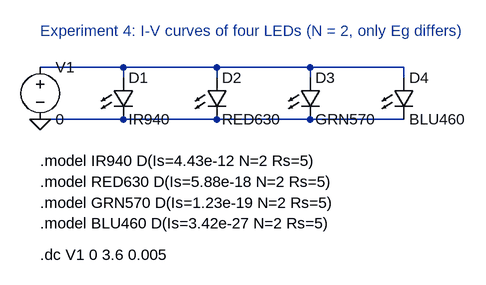
[diagram p0: schematic LED_IV_Kennlinien.asc]
LED_IV_Kennlinien.asc, the LTspice schematic file:
Version 4.1
SHEET 1 880 440
WIRE 80 80 208 80
WIRE 208 80 352 80
WIRE 352 80 496 80
WIRE 496 80 640 80
WIRE 80 160 208 160
WIRE 208 160 352 160
WIRE 352 160 496 160
WIRE 496 160 640 160
WIRE 208 80 208 96
WIRE 352 80 352 96
WIRE 496 80 496 96
WIRE 640 80 640 96
FLAG 80 160 0
SYMBOL voltage 80 64 R0
SYMATTR InstName V1
SYMATTR Value 0
SYMBOL LED 192 96 R0
SYMATTR InstName D1
SYMATTR Value IR940
SYMBOL LED 336 96 R0
SYMATTR InstName D2
SYMATTR Value RED630
SYMBOL LED 480 96 R0
SYMATTR InstName D3
SYMATTR Value GRN570
SYMBOL LED 624 96 R0
SYMATTR InstName D4
SYMATTR Value BLU460
TEXT 80 24 Left 2 ;Experiment 4: I-V curves of four LEDs (N = 2, only Eg differs)
TEXT 80 224 Left 2 !.model IR940 D(Is=4.43e-12 N=2 Rs=5)
TEXT 80 256 Left 2 !.model RED630 D(Is=5.88e-18 N=2 Rs=5)
TEXT 80 288 Left 2 !.model GRN570 D(Is=1.23e-19 N=2 Rs=5)
TEXT 80 320 Left 2 !.model BLU460 D(Is=3.42e-27 N=2 Rs=5)
TEXT 80 368 Left 2 !.dc V1 0 3.6 0.005

The netlist it stands for:
* LED_IV_Kennlinien.asc
V1 N001 0 0
D1 N001 0 IR940
D2 N001 0 RED630
D3 N001 0 GRN570
D4 N001 0 BLU460
.model D D
.lib standard.dio
* Experiment 4: I-V curves of four LEDs (N = 2, only Eg differs)
.model IR940 D(Is=4.43e-12 N=2 Rs=5)
.model RED630 D(Is=5.88e-18 N=2 Rs=5)
.model GRN570 D(Is=1.23e-19 N=2 Rs=5)
.model BLU460 D(Is=3.42e-27 N=2 Rs=5)
.dc V1 0 3.6 0.005
.backanno
.end